# EasyEDA Pro project ProProject_sensor1.4_2025-06-27.epro

# Schematic 传感器课设电路
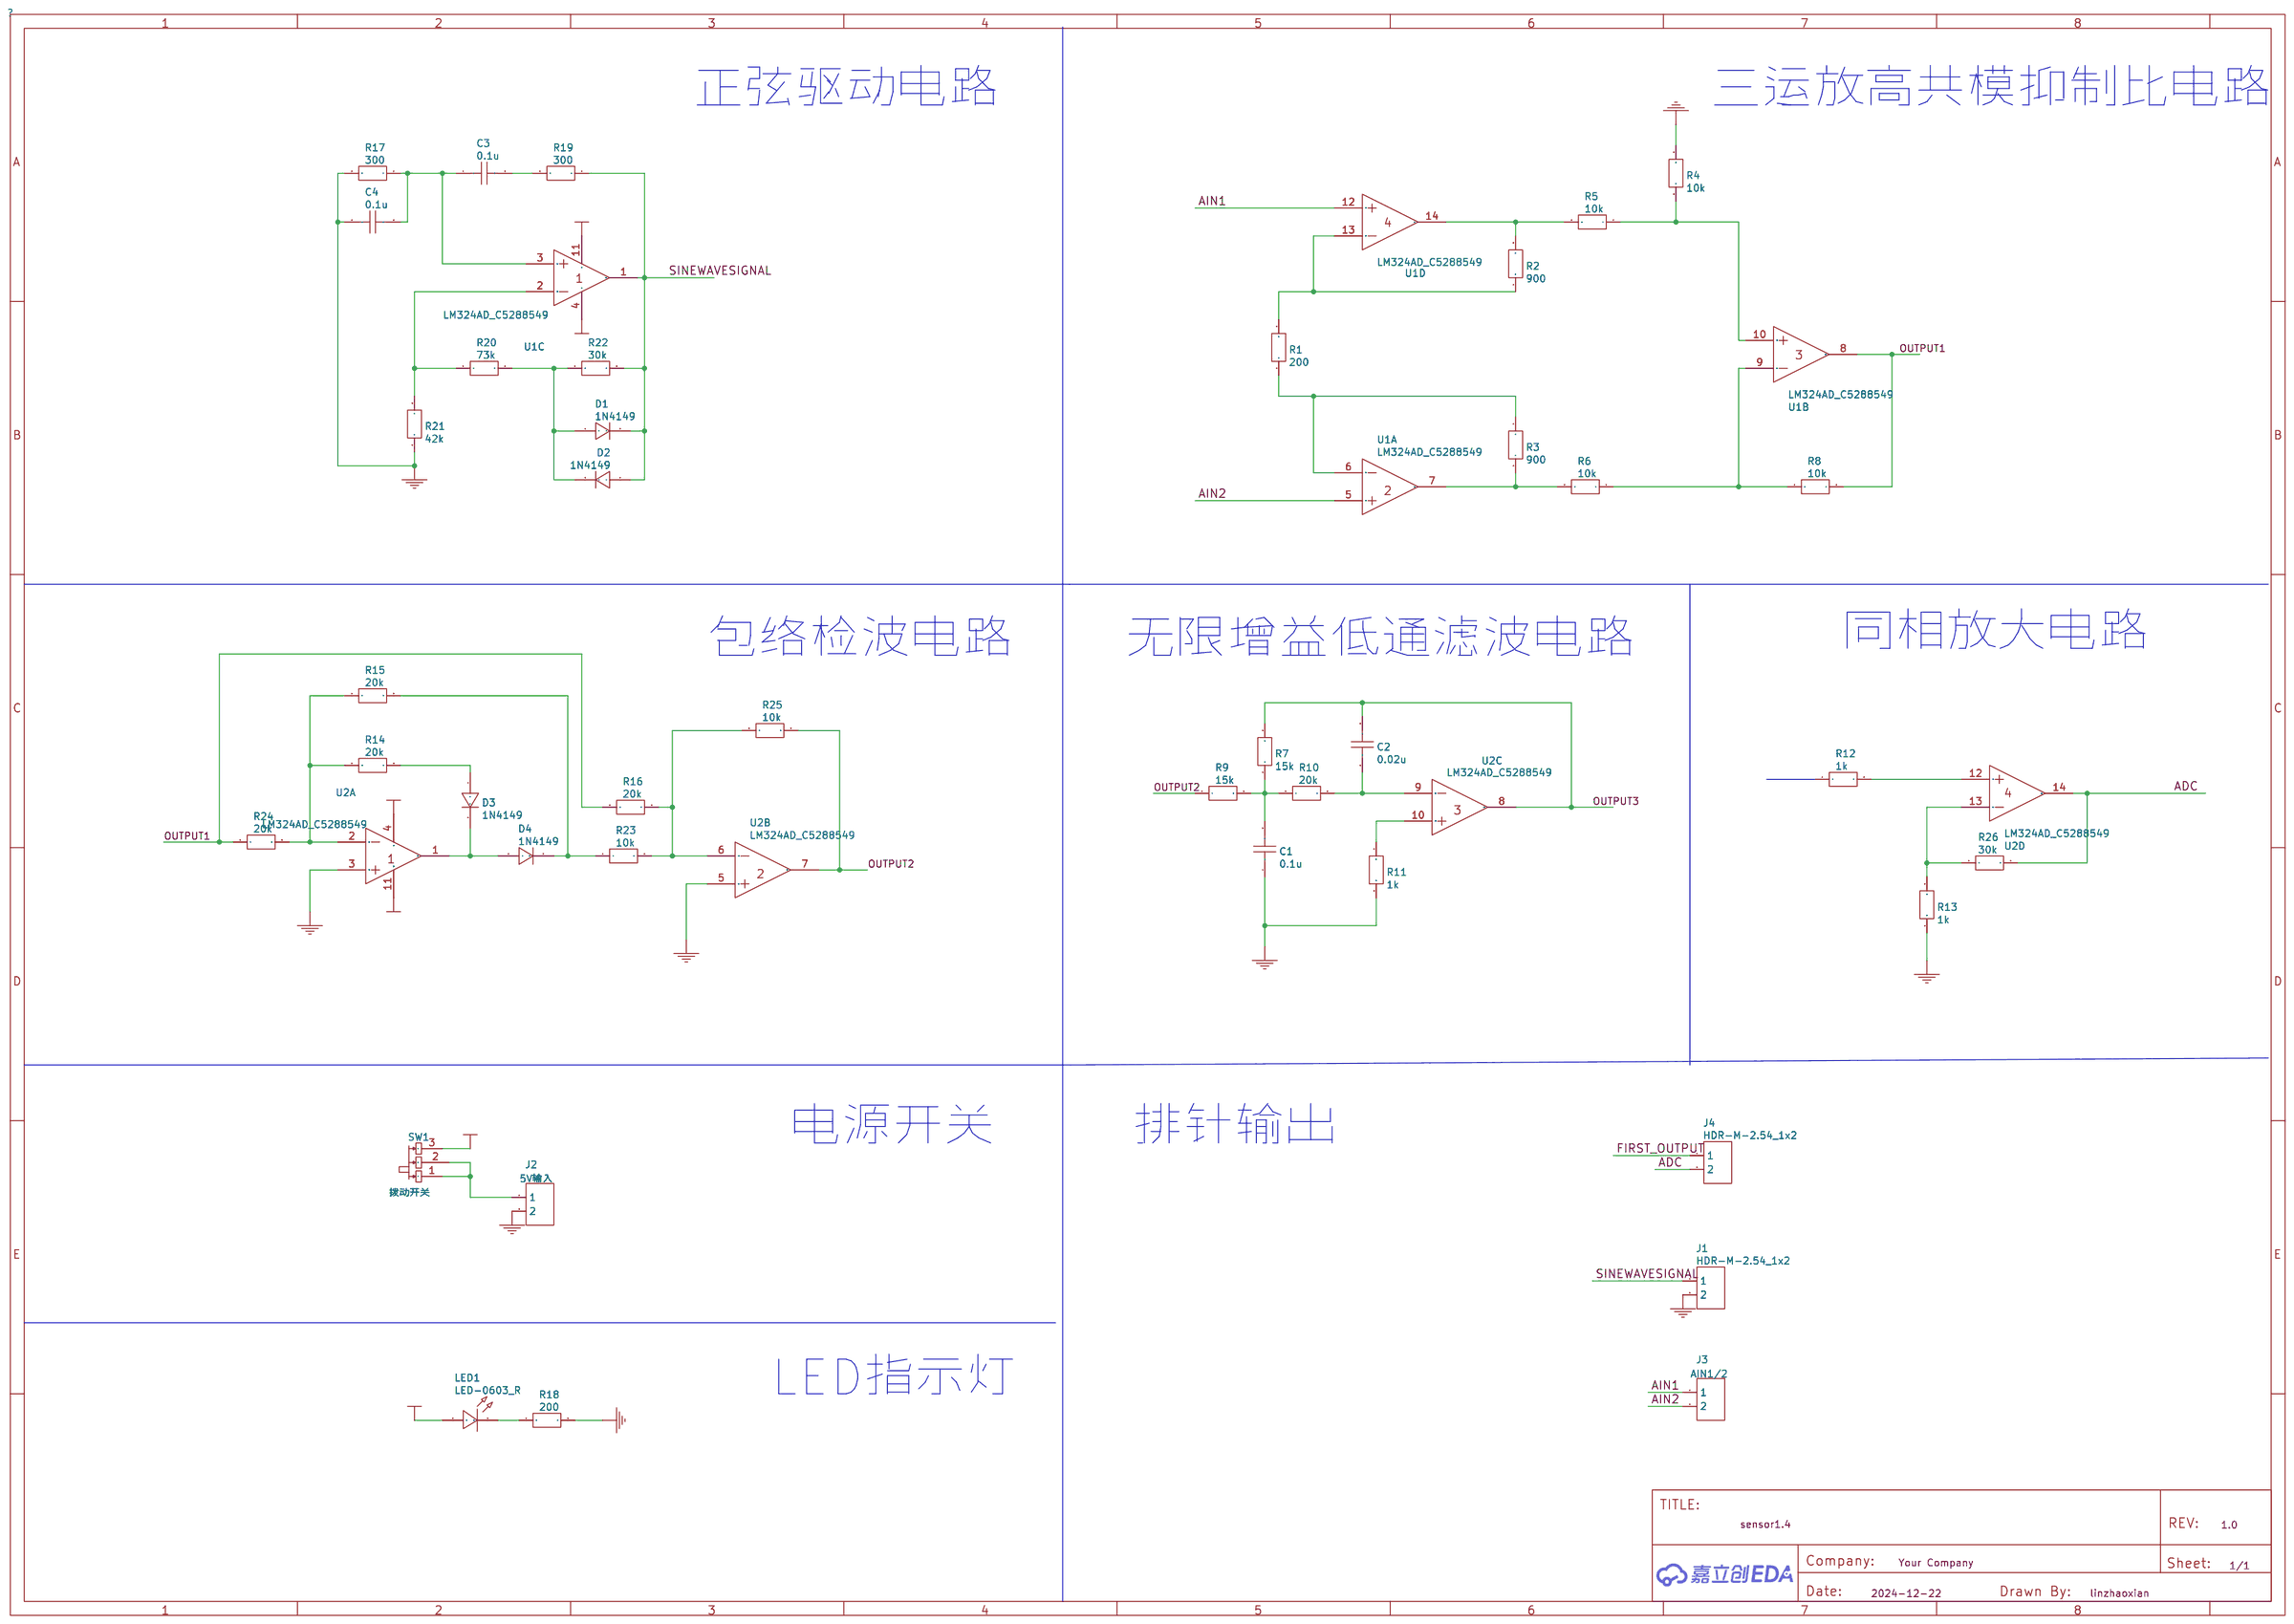
[diagram p0: schematic sheet]

## Parts
C1  0.1u  [C0603]
C2  0.02u  [C0603]
C3  0.1u  [C0603]
C4  0.1u  [C0603]
D1  1N4149  [DO-35_BD2.0-L4.0-P8.00-D0.5-FD]
D2  1N4149  [DO-35_BD2.0-L4.0-P8.00-D0.5-FD]
D3  1N4149  [DO-35_BD2.0-L4.0-P8.00-D0.5-FD]
D4  1N4149  [DO-35_BD2.0-L4.0-P8.00-D0.5-FD]
J1  HDR-M-2.54_1x2  [HDR-M-2.54_1X2]
J2  5V输入  [HDR-M-2.54_1X2]
J3  AIN1/2  [HDR-M-2.54_1X2]
J4  HDR-M-2.54_1x2  [HDR-M-2.54_1X2]
LED1  LED-0603_R  [LED0603_RED]
R1  200  [R0603]
R2  900  [R0603]
R3  900  [R0603]
R4  10k  [R0603]
R5  10k  [R0603]
R6  10k  [R0603]
R7  15k  [R0603]
R8  10k  [R0603]
R9  15k  [R0603]
R10  20k  [R0603]
R11  1k  [R0603]
R12  1k  [R0603]
R13  1k  [R0603]
R14  20k  [R0603]
R15  20k  [R0603]
R16  20k  [R0603]
R17  300  [R0603]
R18  200  [R0603]
R19  300  [R0603]
R20  73k  [R0603]
R21  42k  [R0603]
R22  30k  [R0603]
R23  10k  [R0603]
R24  20k  [R0603]
R25  10k  [R0603]
R26  30k  [R0603]
SW1  拨动开关  [SS12D06开关]
U1  LM324AD_C5288549  [SOIC-14_L8.7-W3.9-P1.27-LS6.0-BL]  (sections 1,2,3,4)
U2  LM324AD_C5288549  [SOIC-14_L8.7-W3.9-P1.27-LS6.0-BL]  (sections 1,2,3,4)

## Library data of the parts
C1 C3 C4 = 0.1u
C2 = 0.02u
D1-D4 = 1N4149: Supplier: LCSC; Supplier Part: C183522; Manufacturer: onsemi(安森美); JLCPCB Part Class: Extended Part
J1 J4 = HDR-M-2.54_1x2: Supplier Part: C124375; Supplier: LCSC
J2 = 5V输入: Supplier Part: C124375; Supplier: LCSC
J3 = AIN1/2: Supplier Part: C124375; Supplier: LCSC
LED1 = LED-0603_R: Manufacturer: EVERLIGHT(台湾亿光); Manufacturer Part: 19-217/R6C-AL1M2VY/3T; Supplier Part: C72044; Supplier: LCSC
R1 R18 = 200
R2 R3 = 900
R4-R6 R8 R23 R25 = 10k
R7 R9 R21 = 15k
R10 R14-R16 R24 = 20k
R11-R13 = 1k
R17 R19 = 315
R20 = 22k
R22 = 14k
R26 = 30k
SW1 = 拨动开关: Supplier: LCSC; Supplier Part: 1; Manufacturer Part: SS12D07VG3; JLCPCB Part Class: Extended Part
U1 U2 = LM324AD_C5288549: Supplier: LCSC; Supplier Part: C5288549; Manufacturer: ST(意法半导体); Manufacturer Part: LM324AD; JLCPCB Part Class: Extended Part

## Nets
+5V: LED1.1 SW1.3
+12V: U1.11(GND) U2.11(GND)
-12V: U1.4(VCC) U2.4(VCC)
GND: C1.1 C4.1 J1.2 J2.2 R4.2 R11.1 R13.2 R17.2 R18.2 R21.2 U2.3(1IN+) U2.5(2IN+)
ADC: J4.2 R26.2 U2.14(4OUT)
AIN1: J3.1 U1.12(4IN+)
AIN2: J3.2 U1.5(2IN+)
FIRST_OUTPUT: J4.1
OUTPUT1: R8.2 R16.1 R24.1 U1.8(3OUT)
OUTPUT2: R9.1 R25.2 U2.7(2OUT)
OUTPUT3: C2.1 R7.2 U2.8(3OUT)
SINEWAVESIGNAL: D1.2(K) D2.1(A) J1.1 R19.1 R22.1 U1.1(1OUT)
C3_2: C3.2 R19.2
LED1_2: LED1.2 R18.1
R1_1: R1.1 R3.2 U1.6(2IN-)
R1_2: R1.2 R2.1 U1.13(4IN-)
R2_2: R2.2 R5.2 U1.14(4OUT)
R3_1: R3.1 R6.2 U1.7(2OUT)
R4_1: R4.1 R5.1 U1.10(3IN+)
R6_1: R6.1 R8.1 U1.9(3IN-)
R7_1: C1.2 R7.1 R9.2 R10.1
R10_2: C2.2 R10.2 U2.9(3IN-)
R11_2: R11.2 U2.10(3IN+)
R12_2: R12.2 U2.12(4IN+)
R13_1: R13.1 R26.1 U2.13(4IN-)
R14_2: D3.1(A) R14.2
R15_2: D4.2(K) R15.2 R23.1
R16_2: R16.2 R23.2 R25.1 U2.6(2IN-)
R17_1: C3.1 C4.2 R17.1 U1.3(1IN+)
R20_1: D1.1(A) D2.2(K) R20.1 R22.2
R20_2: R20.2 R21.1 U1.2(1IN-)
SW1_1: J2.1 SW1.1 SW1.2
U2_1: D3.2(K) D4.1(A) U2.1(1OUT)
U2_2: R14.1 R15.1 R24.2 U2.2(1IN-)

Not connected (* = marked no-connect by the designer): R12 1

## Notes on the sheet
- 正弦驱动电路
- 三运放高共模抑制比电路
- 包络检波电路
- 无限增益低通滤波电路
- 同相放大电路
- 电源开关
- 排针输出
- LED指示灯

# Board PCB_PCB_传感器课设电路_3_2024-12-29
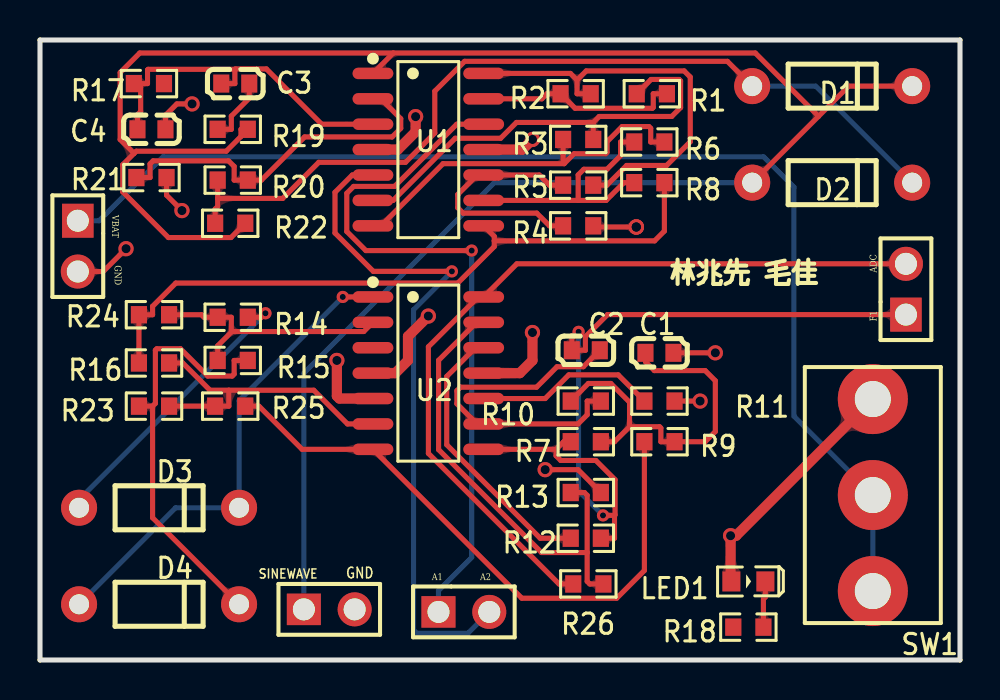
[diagram p1: board, top side]
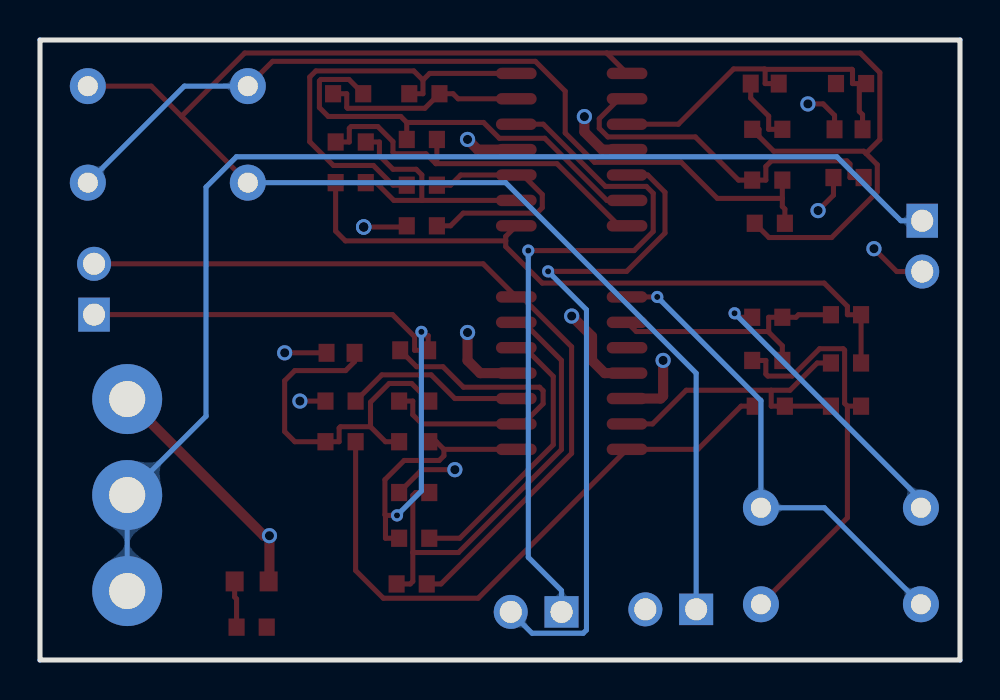
[diagram p2: board, bottom side, seen from below]

Outline 46 x 31 mm; copper layers: Top Layer, VCC, GND, Bottom Layer. Coordinates in mm from the lower left corner of the outline.
Outline path: 0,31 46,31 46,0 0,0 0,31
Stack: Top Layer 0.035mm 外层铜厚1oz / Dielectric1 0.2104mm 7628 RC49% 8.6mil / VCC 0.0152mm 内层铜厚 / Dielectric2 1.065mm 1.1mm H/HOZ 含铜 / GND 0.0152mm 内层铜厚 / Dielectric3 0.2104mm 7628 RC49% 8.6mil / Bottom Layer 0.035mm 外层铜厚1oz

## Design rules (mm)
spacing Default (default): track to track 0.152, other pairs 0 to 0.152
track width Default (default): min 0.254, default 0.254, max 25.4
differential pair differentialPair (default): width min 0.127, default 0.254, max 2.54; gap min 0.152, default 0.152
via Default (default): diameter min 0.61, default 0.61, max 100.025; hole min 0.305, default 0.305, max 59.995

## Placement (name value [footprint] x y rotation side)
C1  0.1u  [C0603]  30.97 15.36 180 top
C2  0.02u  [C0603]  27.29 15.49 0 top
C3  0.1u  [C0603]  9.76 28.82 0 top
C4  0.1u  [C0603]  5.57 26.53 180 top
D1  1N4149  [DO-35_BD2.0-L4.0-P8.00-D0.5-FD]  39.61 28.69 0 top
D2  1N4149  [DO-35_BD2.0-L4.0-P8.00-D0.5-FD]  39.61 23.87 0 top
D3  1N4149  [DO-35_BD2.0-L4.0-P8.00-D0.5-FD]  5.95 7.61 0 top
D4  1N4149  [DO-35_BD2.0-L4.0-P8.00-D0.5-FD]  5.95 2.79 0 top
J2  5V输入  [HDR-M-2.54_1X2]  1.89 20.69 270 top
J3  AIN1/2  [HDR-M-2.54_1X2]  21.19 2.41 0 top
J4  HDR-M-2.54_1x2  [HDR-M-2.54_1X2]  43.3 18.54 90 top
LED1  LED-0603_R  [LED0603_RED]  35.42 3.93 0 top
R1  200  [R0603]  30.59 28.31 0 top
R2  900  [R0603]  26.78 28.31 0 top
R3  900  [R0603]  26.91 26.03 0 top
R4  10k  [R0603]  26.91 21.71 0 top
R5  10k  [R0603]  26.91 23.74 0 top
R6  10k  [R0603]  30.47 25.9 0 top
R7  15k  [R0603]  27.29 10.91 180 top
R8  10k  [R0603]  30.47 23.87 0 top
R9  15k  [R0603]  30.97 10.91 0 top
R10  20k  [R0603]  27.29 12.95 0 top
R11  1k  [R0603]  30.97 12.95 180 top
R12  1k  [R0603]  27.29 6.09 180 top
R13  1k  [R0603]  27.29 8.37 0 top
R14  20k  [R0603]  9.64 17.14 0 top
R15  20k  [R0603]  9.64 14.98 0 top
R16  20k  [R0603]  5.7 14.85 0 top
R17  300  [R0603]  5.45 28.82 0 top
R18  200  [R0603]  35.42 1.64 180 top
R19  300  [R0603]  9.64 26.53 180 top
R20  73k  [R0603]  9.64 24 0 top
R21  42k  [R0603]  5.57 24.12 0 top
R22  30k  [R0603]  9.51 21.84 180 top
R23  10k  [R0603]  5.7 12.69 0 top
R24  20k  [R0603]  5.7 17.26 0 top
R25  10k  [R0603]  9.51 12.69 0 top
R26  30k  [R0603]  27.42 3.8 180 top
SINEWAVE  HDR-M-2.54_1x2  [HDR-M-2.54_1X2]  14.46 2.53 0 top
SW1  拨动开关  [SS12D06开关]  41.64 8.25 180 top
U1  LM324AD_C5288549  [SOIC-14_L8.7-W3.9-P1.27-LS6.0-BL]  19.42 25.52 270 top
U2  LM324AD_C5288549  [SOIC-14_L8.7-W3.9-P1.27-LS6.0-BL]  19.42 14.34 270 top

## Footprints (pads in the part's own frame, mm; a bottom-side part is the same pattern mirrored in y, then rotated)
C0603
  rect 0.8x0.9 smd: 1(-0.7,0) 2(0.7,0)
DO-35_BD2.0-L4.0-P8.00-D0.5-FD
  round 1.8 hole 1: 1(-4,0) 2(4,0)
HDR-M-2.54_1X2
  rect 1.7x1.575 hole 1.1: 1(-1.27,0)
  round 1.7 hole 1.1: 2(1.27,0)
LED0603_RED
  rect 0.9x1 smd: 1(-0.85,0) 2(0.85,0)
R0603
  rect 0.806x0.864 smd: 1(-0.753,0) 2(0.753,0)
SOIC-14_L8.7-W3.9-P1.27-LS6.0-BL
  oval 0.574x2.038 smd: 1(-3.81,-2.769) 2(-2.54,-2.769) 3(-1.27,-2.769) 4(0,-2.769) 5(1.27,-2.769) 6(2.54,-2.769) 7(3.81,-2.769) 8(3.81,2.769) 9(2.54,2.769) 10(1.27,2.769) 11(0,2.769) 12(-1.27,2.769) 13(-2.54,2.769) 14(-3.81,2.769)
SS12D06开关
  round 3.5 hole 1.8: 1(0,4.8) 2(0,0) 3(0,-4.8)

## Nets
+5V: LED1.1 SW1.3 U1.11 U2.11
-5V: U1.4 U2.4
GND: C1.1 C4.1 J2.2 R4.2 R11.1 R13.2 R17.2 R18.2 R21.2 SINEWAVE.2 U2.3 U2.5
ADC: J4.2 R26.2 U2.14
AIN1: J3.1 U1.12
AIN2: J3.2 U1.5
C3_2: C3.2 R19.2
FIRST_OUTPUT: C2.1 J4.1 R7.2 R12.1 U2.8
LED1_2: LED1.2 R18.1
R1_1: R1.1 R3.2 U1.6
R1_2: R1.2 R2.1 U1.13
R2_2: R2.2 R5.2 U1.14
R3_1: R3.1 R6.2 U1.7
R4_1: R4.1 R5.1 U1.10
R6_1: R6.1 R8.1 U1.9
R7_1: C1.2 R7.1 R9.2 R10.1
R8_2: R8.2 R16.1 R24.1 U1.8
R9_1: R9.1 R25.2 U2.7
R10_2: C2.2 R10.2 U2.9
R11_2: R11.2 U2.10
R12_2: R12.2 U2.12
R13_1: R13.1 R26.1 U2.13
R14_2: D3.1 R14.2
R15_2: D4.2 R15.2 R23.1
R16_2: R16.2 R23.2 R25.1 U2.6
R17_1: C3.1 C4.2 R17.1 U1.3
R20_1: D1.1 D2.2 R20.1 R22.2
R20_2: R20.2 R21.1 U1.2
SINEWAVESIGNAL: D1.2 D2.1 R19.1 R22.1 SINEWAVE.1 U1.1
SW1_1: J2.1 SW1.1 SW1.2
U2_1: D3.2 D4.1 U2.1
U2_2: R14.1 R15.1 R24.2 U2.2

## Via types
v1: diameter 0.61, hole 0.305, Top Layer to Bottom Layer, 6 vias
v2: diameter 0.762, hole 0.457, Top Layer to Bottom Layer, 15 vias

## Routing (per net, layer and track width the routed paths; a pad name or vN(x,y) marks a point on that pad's centre or on a via; arc(x,y) is an arc through that point)
+5V: length 19
  Top Layer w0.508: LED1.1 34.53,3.97 v2(34.53,6.22) 34.81,6.22 SW1.3 ; v2(24.62,16.38) 24.62,14.98 23.99,14.34 U2.11 ; v2(24.62,26.03) 24.12,25.52 U1.11
-5V: length 7.9
  Top Layer w0.508: U2.4 17.76,14.34 18.4,14.98 18.4,16.18 v2(19.42,17.2) ; v2(18.78,27.17) 18.78,26.41 17.89,25.52 U1.4
GND: length 19.6
  Top Layer w0.254: R21.2 6.33,23.24 v2(7.1,22.47) ; v2(33,12.95) R11.1 ; v2(4.3,20.57) 3.16,19.42 J2.2 ; v2(7.6,27.81) 6.84,27.81 6.27,27.23 C4.1 ; R13.2 26.9,9.52 v2(25.26,9.52) ; R4.2 27.72,21.65 v2(29.81,21.65) ; v2(33.77,15.36) C1.1
  Top Layer w0.508: v2(14.84,14.98) 14.84,13.2 14.97,13.07 16.65,13.07
ADC: length 40.9
  Top Layer w0.254: J4.2 23.84,19.81 U2.14 21.91,18.15 19.42,15.66 19.42,10.33 25.95,3.8 R26.2
AIN1: length 35.6
  Top Layer w0.254: U1.12 20.84,26.79 17.73,23.68 15.68,23.68 15.34,23.34 15.34,21.43 16.29,20.47 v1(21.59,20.47)
  Bottom Layer w0.254: v1(21.59,20.47) 21.59,5.13 19.92,3.47 J3.1
AIN2: length 34
  Top Layer w0.254: v1(20.59,19.43) 16.67,19.43 14.75,21.35 14.75,23.38 15.61,24.25 16.65,24.25
  Bottom Layer w0.254: v1(20.59,19.43) 18.68,17.51 18.68,1.5 18.84,1.34 21.4,1.34 J3.2
C3_2: length 3.3
  Top Layer w0.254: C3.2 10.46,28.09 9.57,27.19 9.57,26.53 R19.2
FIRST_OUTPUT: length 41.1
  Top Layer w0.254: 28.73,7.23 28.73,6.09 R12.1 ; 28.73,7.23 28.75,7.26 28.75,9.01 27.79,9.98 26.04,9.98 25.8,10.21 25.8,10.53 ; 28.73,7.23 v1(28.15,7.23) ; J4.1 28.37,17.27 27.27,16.17 27.27,15.49 C2.1 26.59,16.22 26.74,16.22 v1(26.93,16.41) ; 25.8,10.53 U2.8 ; 25.8,10.53 26.19,10.91 R7.2
  Bottom Layer w0.254: v1(26.93,16.41) 26.93,8.45 v1(28.15,7.23)
LED1_2: length 2.3
  Top Layer w0.254: LED1.2 36.27,3.15 36.17,3.05 R18.1
R1_1: length 22
  Top Layer w0.254: U1.6 17.65,22.98 20.76,26.09 23.03,26.09 23.82,26.88 27.66,26.88 ; R1.1 30.55,29.03 31.96,29.03 32.03,28.95 32.03,27.62 31.59,27.18 27.96,27.18 27.66,26.88 ; 27.66,26.88 R3.2
R1_2: length 10.3
  Top Layer w0.254: U1.13 25.09,28.06 25.35,28.31 R2.1 26.76,27.59 30.62,27.59 30.66,27.63 30.66,28.31 R1.2
R2_2: length 21.1
  Top Layer w0.254: 22.19,29.33 26.52,29.33 26.85,29 ; 26.85,29 26.85,28.31 R2.2 ; 26.85,29 27.31,29.45 32.21,29.45 32.51,29.15 32.51,25.91 31.33,24.73 29.33,24.73 28.34,23.74 R5.2
R3_1: length 18.9
  Top Layer w0.254: 26.21,24.82 26.7,25.31 28.28,25.31 28.35,25.39 28.35,25.92 29.11,26.67 30.44,26.67 30.54,26.58 30.54,25.9 R6.2 ; 26.21,24.82 20.15,24.82 17.04,21.71 U1.7 ; 26.21,24.82 26.16,24.87 R3.1
R4_1: length 12.2
  Top Layer w0.254: R5.1 25.47,23.74 24.97,24.25 21.86,24.25 20.88,23.27 20.88,22.61 21.16,22.34 24.84,22.34 25.47,21.71 R4.1
R6_1: length 13.1
  Top Layer w0.254: R6.1 29.03,25.9 29.03,25.22 28.35,24.54 27.19,24.54 26.91,24.25 26.91,22.98 ; R8.1 29.19,23.87 28.31,22.98 26.91,22.98 ; 26.91,22.98 U1.9
R7_1: length 18.7
  Top Layer w0.254: 29.48,11.66 30.98,11.66 31.04,11.6 31.04,10.91 R9.2 33.26,10.91 33.77,11.42 33.77,13.96 33.26,14.47 30.72,14.47 30.27,14.92 30.27,15.36 ; 29.48,11.66 28.73,10.91 R7.1 ; 29.48,11.66 29.48,12.89 28.54,13.83 27.42,13.83 R10.1
R8_2: length 34.2
  Top Layer w0.254: 22.71,20.96 22.71,20.67 20.89,18.85 6.79,18.85 5.63,17.69 5.63,17.26 R24.1 R16.1 ; 22.71,20.96 30.73,20.96 31.22,21.45 R8.2 ; 22.71,20.96 22.71,21.18 U1.8
R9_1: length 30.9
  Top Layer w0.254: R9.1 30.22,4.48 28.83,3.09 24.09,3.09 U2.7 13.1,10.53 10.95,12.69 R25.2
R10_2: length 17.1
  Top Layer w0.254: C2.2 27.17,14.66 25.85,14.66 24.83,13.64 21.02,13.64 20.84,13.46 20.84,12.81 21.85,11.8 U2.9 26.9,11.8 27.36,12.26 27.36,12.95 R10.2
R11_2: length 9.1
  Top Layer w0.254: 22.19,13.07 25.26,13.07 26.44,14.26 28.91,14.26 R11.2
R12_2: length 14
  Top Layer w0.254: R12.2 25.01,6.09 20.34,10.76 20.34,14.18 21.77,15.61 U2.12
R13_1: length 23.1
  Top Layer w0.254: 27.36,5.37 25.07,5.37 19.93,10.52 19.93,14.98 21.83,16.88 U2.13 ; 27.36,5.37 27.36,3.93 27.49,3.8 R26.1 ; 27.36,5.37 27.36,8.23 27.22,8.37 R13.1
R14_2: length 14.5
  Top Layer w0.254: R14.2 11.07,17.14 v1(11.27,17.34)
  Bottom Layer w0.254: D3.1 1.95,8.02 v1(11.27,17.34)
R15_2: length 21.2
  Top Layer w0.254: 5.63,12.69 5.63,7.11 D4.2 ; 5.63,12.69 5.77,12.83 5.77,15.49 5.84,15.56 7.02,15.56 8.39,14.2 9.61,14.2 9.71,14.3 9.71,14.98 R15.2 ; 5.63,12.69 R23.1
R16_2: length 15.2
  Top Layer w0.254: R16.2 7.14,14.85 8.5,13.49 9.44,13.49 ; 9.44,13.49 13.69,13.49 15.37,11.8 U2.6 ; 9.44,13.49 9.44,12.69 R25.1 R23.2
R17_1: length 17.5
  Top Layer w0.254: C3.1 9.74,28.82 9.74,29.51 ; 5.03,28.82 5.03,27.43 4.87,27.26 4.87,26.53 ; 5.03,28.82 5.38,28.82 5.38,29.5 5.41,29.53 9.72,29.53 9.74,29.51 ; 5.03,28.82 R17.1 ; 9.74,29.51 9.78,29.55 11.32,29.55 14.08,26.79 U1.3
R20_1: length 43.5
  Top Layer w0.254: D1.1 34.37,29.93 21.23,29.93 19.74,28.44 19.74,26.35 18.27,24.88 13.94,24.88 12.14,23.08 8.88,23.08 ; 8.88,23.08 8.88,22.67 8.76,22.55 R22.2 ; 8.88,23.08 R20.1
  Bottom Layer w0.254: D2.2 38.78,28.69 D1.1
R20_2: length 18.1
  Top Layer w0.254: R21.1 5.5,24.12 5.5,24.81 5.65,24.96 9.43,24.96 9.71,24.68 9.71,24 R20.2 11.07,24 13.23,26.15 17.61,26.15 18.04,26.58 18.04,27.06 17.04,28.06 U1.2
SINEWAVESIGNAL: length 106.5
  Top Layer w0.254: 17.67,30.35 35.76,30.35 38.93,27.19 ; 17.67,30.35 16.65,29.33 ; 17.67,30.35 4.99,30.35 4.01,29.37 4.01,26.02 4.7,25.33 ; 38.93,27.19 D2.1 ; 38.93,27.19 40.44,28.69 D1.2 ; R19.1 10.05,26.53 10.05,26.18 9.31,25.44 4.81,25.44 4.7,25.33 ; 4.7,25.33 4.13,24.76 4.13,23.41 6.42,21.12 9.55,21.12 R22.1
  Bottom Layer w0.254: D2.1 22.72,23.87 13.19,14.34 SINEWAVE.1
SW1_1: length 59.6
  Bottom Layer w0.254: J2.1 2.96,21.96 6.16,25.16 36.18,25.16 37.7,23.64 37.7,12.19 SW1.2 SW1.1
U2_1: length 24.2
  Top Layer w0.254: U2.1 v1(15.14,18.15)
  Bottom Layer w0.254: v1(15.14,18.15) 9.95,12.97 D3.2 6.78,7.61 D4.1
U2_2: length 12.9
  Top Layer w0.254: U2.2 16.19,16.42 9.6,16.42 ; R24.2 8.07,17.26 8.2,17.14 R14.1 9.57,17.14 9.57,16.45 9.6,16.42 ; 9.6,16.42 8.88,15.71 R15.1

## Copper pours and planes (outline as drawn; the poured copper is in the pictures)
+5V on VCC: 0.16,30.84 45.84,30.84 45.84,0.16 0.16,0.16
+5V on VCC: 40.76,13.92 44.53,13.92 44.53,12.17 40.76,12.17
+5V on VCC: 38.75,13.92 42.52,13.92 42.52,12.17 38.75,12.17
+5V on VCC: 40.76,13.93 42.52,13.93 42.52,10.16 40.76,10.16
+5V on VCC: 40.76,15.94 42.52,15.94 42.52,12.17 40.76,12.17
-5V on VCC: 14.34,30.84 23.35,30.84 23.35,8.5 14.34,8.5
GND on Top Layer: -2.81,35.17 48.37,35.17 48.37,-2.93 -2.81,-2.93
GND on Bottom Layer: -2.43,33.52 48.37,33.52 48.37,-1.91 -2.43,-1.91
GND on GND: 1.46,19.85 2.32,19.85 2.32,17.89 1.46,17.89
GND on GND: 0.16,30.84 45.84,30.84 45.84,0.16 0.16,0.16
GND on GND: 15.31,4.07 16.16,4.07 16.16,2.11 15.31,2.11
GND on GND: 1.46,20.96 2.32,20.96 2.32,19 1.46,19
GND on GND: 1.47,19.85 3.42,19.85 3.42,19 1.47,19
GND on GND: 0.36,19.85 2.31,19.85 2.31,19 0.36,19
GND on GND: 14.2,2.96 16.16,2.96 16.16,2.1 14.2,2.1
GND on GND: 15.31,2.96 17.27,2.96 17.27,2.1 15.31,2.1
GND on GND: 15.31,2.96 16.16,2.96 16.16,1 15.31,1

Small or netless copper shapes (teardrops, artwork), in the pictures only: 132 on Top Layer, 18 on Bottom Layer

## Text on the board
Top Silkscreen Layer: GND | A1 | A2 | ADC | F1 | VBAT | 林兆先 毛佳
